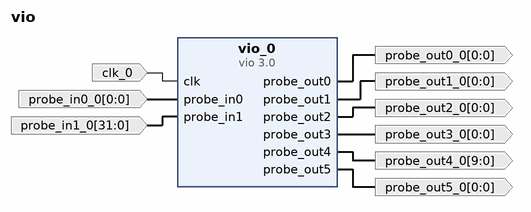
[diagram p0: block diagram of the top level]
# Vivado block design vio, xc7a35ticsg324-1L, Vivado 2025.2
create_bd_design vio

create_bd_port -dir I -type clk clk_0
create_bd_port -dir I -from 0 -to 0 probe_in0_0
create_bd_port -dir I -from 31 -to 0 probe_in1_0
create_bd_port -dir O -from 0 -to 0 probe_out0_0
create_bd_port -dir O -from 0 -to 0 probe_out1_0
create_bd_port -dir O -from 0 -to 0 probe_out2_0
create_bd_port -dir O -from 0 -to 0 probe_out3_0
create_bd_port -dir O -from 9 -to 0 probe_out4_0
create_bd_port -dir O -from 0 -to 0 probe_out5_0

create_bd_cell -type ip -vlnv xilinx.com:ip:vio:3.0 vio_0
set_property -dict [list \
  CONFIG.C_NUM_PROBE_IN 2 \
  CONFIG.C_NUM_PROBE_OUT 6 \
  CONFIG.C_PROBE_IN1_WIDTH 32 \
  CONFIG.C_PROBE_OUT4_WIDTH 10 \
] [get_bd_cells vio_0]

# ---- connections ----

connect_bd_net -net clk_0_1 [get_bd_ports clk_0] [get_bd_pins vio_0/clk]
connect_bd_net -net probe_in0_0_1 [get_bd_ports probe_in0_0] [get_bd_pins vio_0/probe_in0]
connect_bd_net -net probe_in1_0_1 [get_bd_ports probe_in1_0] [get_bd_pins vio_0/probe_in1]
connect_bd_net [get_bd_pins vio_0/probe_out0] [get_bd_ports probe_out0_0]
connect_bd_net [get_bd_pins vio_0/probe_out1] [get_bd_ports probe_out1_0]
connect_bd_net [get_bd_pins vio_0/probe_out2] [get_bd_ports probe_out2_0]
connect_bd_net [get_bd_pins vio_0/probe_out3] [get_bd_ports probe_out3_0]
connect_bd_net [get_bd_pins vio_0/probe_out4] [get_bd_ports probe_out4_0]
connect_bd_net [get_bd_pins vio_0/probe_out5] [get_bd_ports probe_out5_0]

validate_bd_design
save_bd_design
